# Altium schematic sheet ESP32.SchDoc
size 381 x 241 mm; SheetNumber: 2; SheetTotal: 3
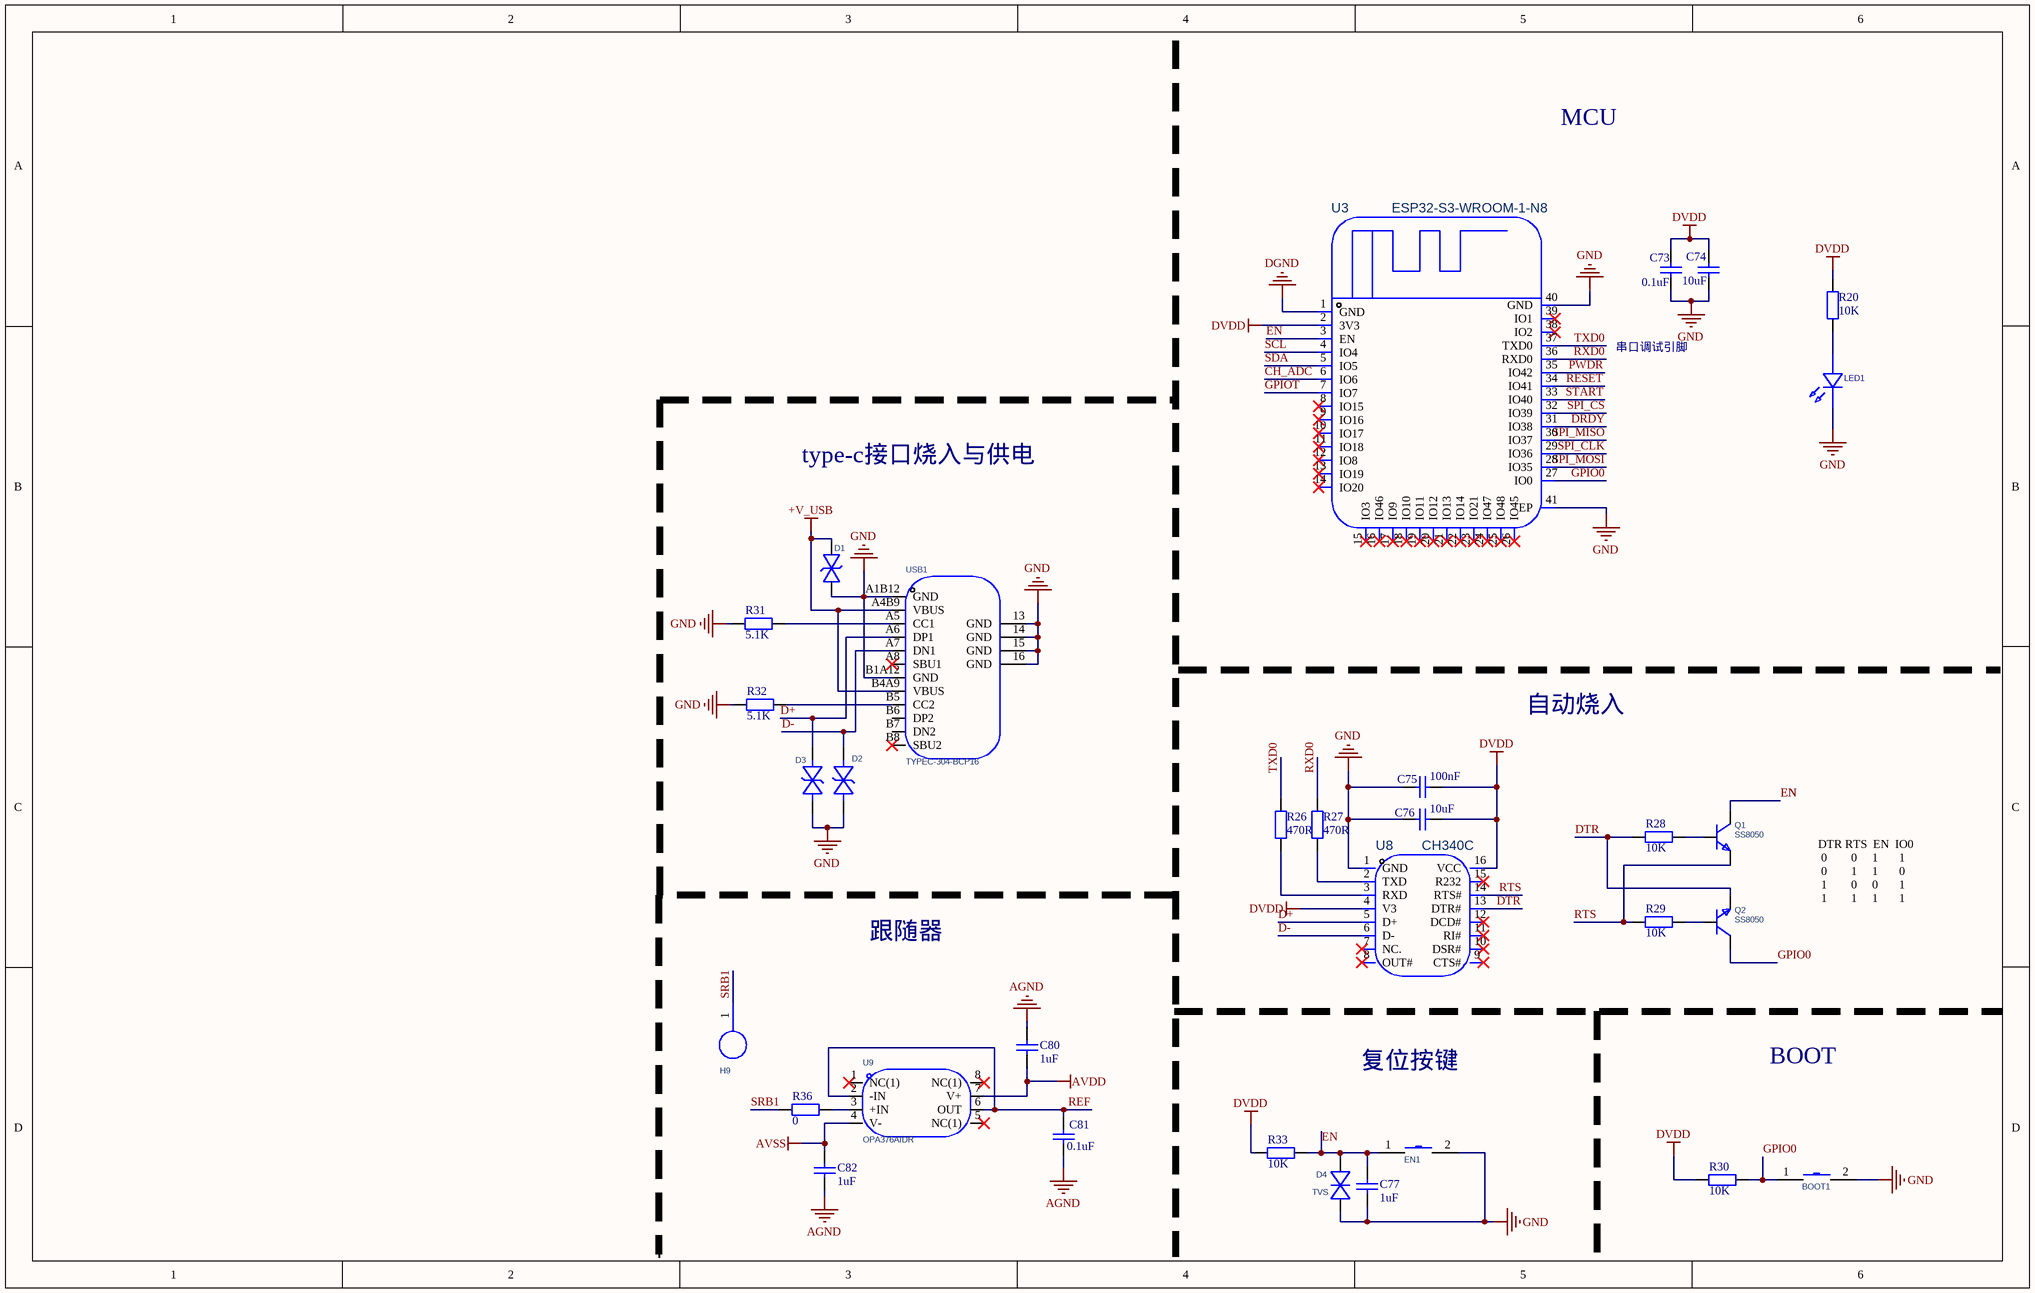
[diagram p0: ESP32.SchDoc]

## Parts
BOOT1  TS-1101-C-W  [SW-SMD_L6.0-W3.3-LS8.0]  (value not drawn)
C73  0.1uF  [C0603]
C74  10uF  [C0603]
C75  100nF  [C0603]
C76  10uF  [C0603]
C77  1uF  [C0603]
C80  1uF  [C0603]
C81  0.1uF  [C0603]
C82  1uF  [C0603]
D1  SMBJ5.0CA  [SMB_L4.5-W3.6-LS5.2-BI]  (value not drawn)
D2  ESD8011MUT5G(ES)  [X3-DFN0603-2_L0.6-W0.3-BI]  (value not drawn)
D3  ESD8011MUT5G(ES)  [X3-DFN0603-2_L0.6-W0.3-BI]  (value not drawn)
D4  TVS  [SMB_L4.3-W3.6-LS5.4-BI]
EN1  TS-1101-C-W  [SW-SMD_L6.0-W3.3-LS8.0]  (value not drawn)
H9  PZ254V-11-01P  [HDR-TH_1P-P2.54-V-M]  (value not drawn)
LED1  XL-1608SURC-06  [LED0603-RD_RED]  (value not drawn)
Q1  SS8050  [SOT-23-3_L2.9-W1.3-P1.90-LS2.4-BR]
Q2  SS8050  [SOT-23-3_L2.9-W1.3-P1.90-LS2.4-BR]
R20  10K  [R0603]
R26  470R  [R0603]
R27  470R  [R0603]
R28  10K  [R0603]
R29  10K  [R0603]
R30  10K  [R0603]
R31  5.1K  [R0603]
R32  5.1K  [R0603]
R33  10K  [R0603]
R36  0  [R0805]
U3  ESP32-S3-WROOM-1-N8  [WIFIM-SMD_ESP32-S3-WROOM-1-N8]
U8  CH340C  [SOP-16_L10.0-W3.9-P1.27-LS6.0-BL]
U9  OPA376AIDR  [SOIC-8_L4.9-W3.9-P1.27-LS6.0-BL]
USB1  TYPEC-304-BCP16  [USB-C-SMD_TYPEC-304-BCP16]

## Nets
+V_USB: D1.2 USB1.A4B9(VBUS) USB1.B4A9(VBUS)
AGND: C80.2 C81.1 C82.2
AVDD: C80.1 U9.7(V+)
AVSS: C82.1 U9.4(V-)
DGND: U3.1(GND)
DVDD: C73.1 C74.1 C75.2 C76.2 R20.2 R30.1 R33.1 U3.2(3V3) U8.4(V3) U8.16(VCC)
GND: BOOT1.2 C73.2 C74.2 C75.1 C76.1 C77.2 D1.1 D2.1(C) D3.1(C) D4.1(C) EN1.2 LED1.1(K) R31.2 R32.2 U3.40(GND) U3.41(EP) U8.1(GND) USB1.13(GND) USB1.14(GND) USB1.15(GND) USB1.16(GND) USB1.A1B12(GND) USB1.B1A12(GND)
CH_ADC: U3.6(IO6)
D+: D3.2(A) U8.5(D+) USB1.A6(DP1)
D-: D2.2(A) U8.6(D-) USB1.A7(DN1)
DRDY: U3.31(IO38)
DTR: Q2.2(E) R28.1 U8.13(DTR#)
EN: C77.1 D4.2(A) EN1.1 Q1.3(C) R33.2 U3.3(EN)
GPIO0: BOOT1.1 Q2.3(C) R30.2 U3.27(IO0)
GPIOT: U3.7(IO7)
PWDR: U3.35(IO42)
REF: C81.2 U9.2(-IN) U9.6(OUT)
RESET: U3.34(IO41)
RTS: Q1.2(E) R29.1 U8.14(RTS#)
RXD0: R27.2 U3.36(RXD0)
SCL: U3.4(IO4)
SDA: U3.5(IO5)
SPI_CLK: U3.29(IO36)
SPI_CS: U3.32(IO39)
SPI_MISO: U3.30(IO37)
SPI_MOSI: U3.28(IO35)
SRB1: H9.1 R36.2
START: U3.33(IO40)
TXD0: R26.2 U3.37(TXD0)
NetLED1_2: LED1.2(A) R20.1
NetQ1_1: Q1.1(B) R28.2
NetQ2_1: Q2.1(B) R29.2
NetR26_1: R26.1 U8.3(RXD)
NetR27_1: R27.1 U8.2(TXD)
NetR31_1: R31.1 USB1.A5(CC1)
NetR32_1: R32.1 USB1.B5(CC2)
NetR36_1: R36.1 U9.3(+IN)

Not connected (* = marked no-connect by the designer): U3 8(IO15)* 9(IO16)* 10(IO17)* 11(IO18)* 12(IO8)* 13(IO19)* 14(IO20)* 15(IO3)* 16(IO46)* 17(IO9)* 18(IO10)* 19(IO11)* 20(IO12)* 21(IO13)* 22(IO14)* 23(IO21)* 24(IO47)* 25(IO48)* 26(IO45)* 38(IO2)* 39(IO1)*; U8 7(NC.)* 8(OUT#)* 9(CTS#)* 10(DSR#)* 11(RI#)* 12(DCD#)* 15(R232)*; U9 1(NC(1))* 5(NC(1))* 8(NC(1))*; USB1 A8(SBU1)* B6(DP2) B7(DN2) B8(SBU2)*

## Notes on the sheet
- MCU
- 串口调试引脚
- type-c接口烧入与供电
- 自动烧入
- DTR RTS  EN  IO0
  0        0     1       1
  0        1     1       0
  1        0     0       1
  1        1     1       1
- 跟随器
- 复位按键
- BOOT

## Library data of the parts
BOOT1 EN1 = TS-1101-C-W: Manufacturer: XKB Connectivity(中国星坤); Add into BOM: yes; Circuit: 单刀单掷; Actuator Style: 矩形按钮; Operating Force: 260gf; Switch Length: 6mm; Switch Width: 3.6mm; Switch Height: 2.5mm; Strike Gundam: 不带; Contact Current: 50mA; Voltage Rating (DC): 12V; Actuator/Cap Color: 白色带淡绿; With Lamp: 无; Mechanical Life: 5万次; Symbol: TS-1101-C-W; Device: TS-1101-C-W; LCSC Part Name: 6*3.6*2.5mm 立贴 轻触开关; Supplier Part: C318938; Manufacturer Part: TS-1101-C-W; Supplier Footprint: SMD; JLCPCB Part Class: Extended Part; Datasheet: https://atta.szlcsc.com/upload/public/pdf/source/20200227/C318938_C2E53B1EEDE37D980A33616AC086DE53.pdf; Supplier: LCSC; Convert to PCB: yes; Mounting Style: 立贴; Voltage Rating (AC): -; Power Rating: -; Insulation Resistance: -; IP Rating: -; Pin Style: -; Operating Temperature: -30℃~+85℃
C73 C81 = C0603: CAP CER 0.1UF 50V, 10% X7R 0603; Value: 104; Published: 8-Jun-2000; LatestRevisionDate: 17-Jul-2002; LatestRevisionNote: Re-released for DXP Platform.; Publisher: Altium Limited
C74 C75 = C0603: CAP CER 1UF 25V, 10% X5R 0603; Value: 104; Published: 8-Jun-2000; LatestRevisionDate: 17-Jul-2002; LatestRevisionNote: Re-released for DXP Platform.; Publisher: Altium Limited
C76 = C0603: CAP CER 10UF 25V, 10% X5R 0603; Value: 104; Published: 8-Jun-2000; LatestRevisionDate: 17-Jul-2002; LatestRevisionNote: Re-released for DXP Platform.; Publisher: Altium Limited
C77 C80 C82 = C0603: CAP CER 1UF 25V, 10% X7R 0603; Value: 104; Published: 8-Jun-2000; LatestRevisionDate: 17-Jul-2002; LatestRevisionNote: Re-released for DXP Platform.; Publisher: Altium Limited
D1 = SMBJ5.0CA_C19077559: PWR; Manufacturer: 宏嘉诚; Add into BOM: yes; Polarity: 双向; Reverse Stand-Off Voltage (Vrwm): 5V; Clamping Voltage: 9.2V; Peak Pulse Current (Ipp): 65.22A; Peak Pulse Power Dissipation (Ppp): 600W; Voltage - Breakdown: 7V; Reverse Leakage Current (Ir): 800uA; Type: TVS; Symbol: SMBJ5.0CA_C19077559; Device: SMBJ5.0CA_C19077559; LCSC Part Name: SMBJ5.0CA; Supplier Part: C19077559; Manufacturer Part: SMBJ5.0CA; Supplier Footprint: SMB; JLCPCB Part Class: Extended Part; Datasheet: https://atta.szlcsc.com/upload/public/pdf/source/20250107/474F05451FC8AB27D7FA0238914F96F6.pdf; Supplier: LCSC; Convert to PCB: yes; Operating Temperature: -
D2 D3 = ESD8011MUT5G(ES): 高速低电容; Manufacturer: ElecSuper(静芯微); Add into BOM: yes; Reverse Stand-Off Voltage (Vrwm): 5V; Clamping Voltage: 5.5V; Peak Pulse Current (Ipp): 4.5A; Peak Pulse Power Dissipation (Ppp): 40W; Voltage - Breakdown: 7.8V; Reverse Leakage Current (Ir): 100nA; Symbol: ESD8011MUT5G(ES); Device: ESD8011MUT5G(ES); LCSC Part Name: 极低电容0.1pF，1.0/1.5/3.3/5.0V深回扫超低电容超低钳位单路双向ESD防护器件，4.5A、10kV、0.1pF；Thounderbolt5、USB4.0 80G-120G信号线超高速通讯防护。; Supplier Part: C42400200; Manufacturer Part: ESD8011MUT5G(ES); Supplier Footprint: DFN0603-2L; Datasheet: https://atta.szlcsc.com/upload/public/pdf/source/20241127/8BB72D6002C01DA826D69227B9BFDA64.pdf; Supplier: LCSC; Convert to PCB: yes; Operating Temperature: -50℃~+125℃
D4 = SMBJ3.3CA_C19077557: 3.3V KEY; Manufacturer: 宏嘉诚; Add into BOM: yes; Polarity: 双向; Clamping Voltage: 8V; Peak Pulse Current (Ipp): 75A; Peak Pulse Power Dissipation (Ppp): 600W; Voltage - Breakdown: 6.5V; Reverse Leakage Current (Ir): 600uA; Symbol: SMBJ3.3CA_C19077557; Device: SMBJ3.3CA_C19077557; LCSC Part Name: SMBJ3.3CA; Supplier Part: C19077557; Manufacturer Part: SMBJ3.3CA; Supplier Footprint: SMB; JLCPCB Part Class: Extended Part; Datasheet: https://atta.szlcsc.com/upload/public/pdf/source/20250107/474F05451FC8AB27D7FA0238914F96F6.pdf; Supplier: LCSC; Convert to PCB: yes; Reverse Stand-Off Voltage (Vrwm): 3.3V; Operating Temperature: -; Type: TVS
H9 = PZ254V-11-01P: Manufacturer: XFCN(兴飞); Add into BOM: yes; Pin Structure: 1x1P; Pitch: 2.54mm; Circluar Pins/Square Pins: 方针; Symbol: PZ254V-11-01P; Device: PZ254V-11-01P; LCSC Part Name: 1x1P 间距:2.54mm 方针 直插; Supplier Part: C492400; Manufacturer Part: PZ254V-11-01P; Supplier Footprint: 插件,P=2.54mm; JLCPCB Part Class: Extended Part; Datasheet: https://atta.szlcsc.com/upload/public/pdf/source/20200309/C492400_46876A5B545F5AE6B8D4A09C46E276E8.pdf; Supplier: LCSC; Convert to PCB: yes; Row Spacing: -; Mounting Type: 直插; Number of Rows: 单排; Number of Pins: 1P; Current Rating: -; Voltage Rating (Max): -; Length of Mating Pin: 6mm; Insulation Height: 2.5mm; Length of End Connection Pin: 3mm; Contact Material: 黄铜; Contact Plating: -; Operating Temperature: -40℃~+105℃; Color: 黑色
LED1 = XL-1608SURC-06: Manufacturer: XINGLIGHT(成兴光); Add into BOM: yes; Illumination Color: 红色; Voltage - Forward(Vf): 2.3V; Power(Watts): 50mW; Forward Current: 20mA; Wavelength - Dominant: 620nm~630nm; Peak Wavelength: 625nm; Lens Color: 无色透明透镜; Luminous Intensity: 225mcd; Viewing Angle: 120°; Mounting Sytle: 正贴; Symbol: XL-1608SURC-06; Device: XL-1608SURC-06; LCSC Part Name: XL-1608SURC-06; Supplier Part: C965799; Manufacturer Part: XL-1608SURC-06; Supplier Footprint: 0603; JLCPCB Part Class: Extended Part; Datasheet: https://atta.szlcsc.com/upload/public/pdf/source/20250213/F9766CE804AF391355DCDD48DB3E0DAB.pdf; Supplier: LCSC; Convert to PCB: yes; Lamp Holder Type: -; Diode Configuration: -; Color Temperature: -; Operating Temperature: -20℃~+85℃
Q1 Q2 = SS8050_C7420370: NPN; Manufacturer: 宏嘉诚; Add into BOM: yes; Current - Collector(Ic): 1.5A; Collector - Emitter Voltage VCEO: 25V; Pd - Power Dissipation: 300mW; DC Current Gain: 120@100mA,1.0V; Transition frequency(fT): 100MHz; Current - Collector Cutoff: 100nA; Vce Saturation(VCE(sat)): 500mV; Symbol: SS8050_C7420370; Device: SS8050_C7420370; LCSC Part Name: H档 200-350; Supplier Part: C7420370; Manufacturer Part: SS8050; Supplier Footprint: SOT-23; JLCPCB Part Class: Extended Part; Datasheet: https://atta.szlcsc.com/upload/public/pdf/source/20250205/5DB94E86981B5B1A1866D18E379C0D4F.pdf; Supplier: LCSC; Convert to PCB: yes; type: NPN; Operating Temperature: -55℃~+150℃
R20 R26-R33 = R0603: Resistor; Published: 8-Jun-2000; LatestRevisionDate: 17-Jul-2002; LatestRevisionNote: Re-released for DXP Platform.; Publisher: Altium Limited
R36 = R0805: RES 0 OHM 1/8W 1% 0805 SMD; Published: 8-Jun-2000; LatestRevisionDate: 17-Jul-2002; LatestRevisionNote: Re-released for DXP Platform.; Publisher: Altium Limited
U3 = ESP32-S3-WROOM-1-N8: Manufacturer: ESPRESSIF(乐鑫); Add into BOM: yes; Core Processor: ESP32-S3芯片; Support Interface: I2C；GPIO；SPI；PWM；ADC；UART；USB；I2S; Value: 2.4GHz; Symbol: ESP32-S3-WROOM-1-N8; Device: ESP32-S3-WROOM-1-N8; LCSC Part Name: 通用型Wi-Fi+低功耗蓝牙MCU模组; Supplier Part: C2913198; Manufacturer Part: ESP32-S3-WROOM-1-N8; Supplier Footprint: SMD,18x25.5mm; JLCPCB Part Class: Extended Part; Datasheet: https://atta.szlcsc.com/upload/public/pdf/source/20221026/9A44C6421221D672346AAE72DF9F8146.pdf; Supplier: LCSC; Convert to PCB: yes
U8 = CH340C: Manufacturer: WCH(南京沁恒); Add into BOM: yes; Applications Function: 收发器; Protocol: USB 2.0; Voltage - Supply: 3.3V；5V; Data Rate: 2Mbps; Symbol: CH340C; Device: CH340C; LCSC Part Name: CH340C; Supplier Part: C84681; Manufacturer Part: CH340C; Supplier Footprint: SOP-16; JLCPCB Part Class: Extended Part; Datasheet: https://atta.szlcsc.com/upload/public/pdf/source/20240619/63986D8440D4E5267A77ACD891CC4DE3.pdf; Supplier: LCSC; Convert to PCB: yes
U9 = OPA376AIDR: Manufacturer: TI(德州仪器); Add into BOM: yes; Number of Channels: 单路; Gain Bandwidth Product: 5.5MHz; Ib - Input Bias Current: 0.2pA; Slew Rate: 2V/us; Output Current: 50mA; Symbol: OPA376AIDR; Device: OPA376AIDR; LCSC Part Name: OPA376AIDR; Supplier Part: C2058339; Manufacturer Part: OPA376AIDR; Supplier Footprint: SOIC-8; JLCPCB Part Class: Extended Part; Datasheet: https://www.ti.com/cn/lit/gpn/opa2376; Supplier: LCSC; Convert to PCB: yes; Output Type: -; Rail to Rail: -; Operating Temperature: -40℃~+125℃
USB1 = TYPEC-304-BCP16_C720629: Manufacturer: XUNPU(讯普); Add into BOM: yes; Connector Type: Type-C; Protocol Standard: USB 3.1; Gender: 母; Number of Contacts: 16P; Number of Ports: 1; Current Rating-Power: 3A; Symbol: TYPEC-304-BCP16; Device: TYPEC-304-BCP16_C720629; LCSC Part Name: 停产 Type-C 母 卧贴; Supplier Part: C720629; Manufacturer Part: TYPEC-304-BCP16; Supplier Footprint: SMD; JLCPCB Part Class: Extended Part; Datasheet: https://atta.szlcsc.com/upload/public/pdf/source/20220210/1FE0FEFF7D6A20C111212527D3DED014.pdf; Supplier: LCSC; Convert to PCB: yes; Mounting Type: 卧贴; Operating Temperature: -25℃~+85℃